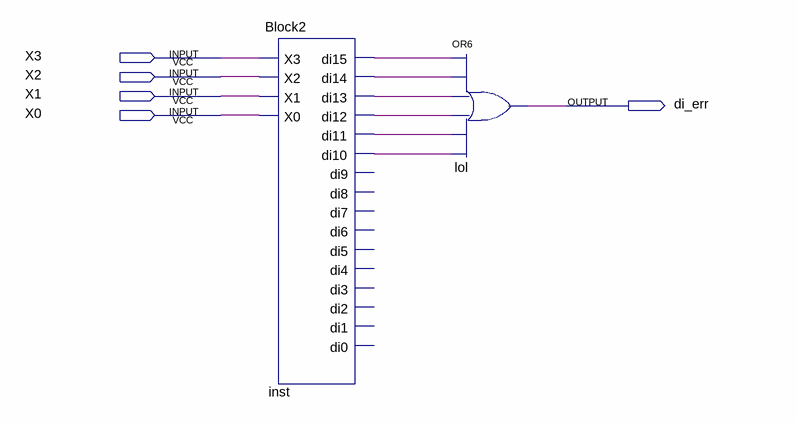
[diagram p0: schematic sheet]
// Quartus schematic block10.bdf as structural Verilog: 2 symbols, 5 pins
module block10 (
  input  X3,
  input  X2,
  input  X1,
  input  X0,
  output di_err
);

  wire inst_di10, inst_di11, inst_di12, inst_di13, inst_di14, inst_di15;

  Block2 inst (
    .X3(X3), .X2(X2), .X1(X1), .X0(X0), .di15(inst_di15), .di14(inst_di14), .di13(inst_di13),
    .di12(inst_di12), .di11(inst_di11), .di10(inst_di10));  // open: di9, di8, di7, di6, di5, di4, di3, di2, di1, di0
  or lol (di_err, inst_di15, inst_di14, inst_di13, inst_di12, inst_di11, inst_di10);
endmodule
